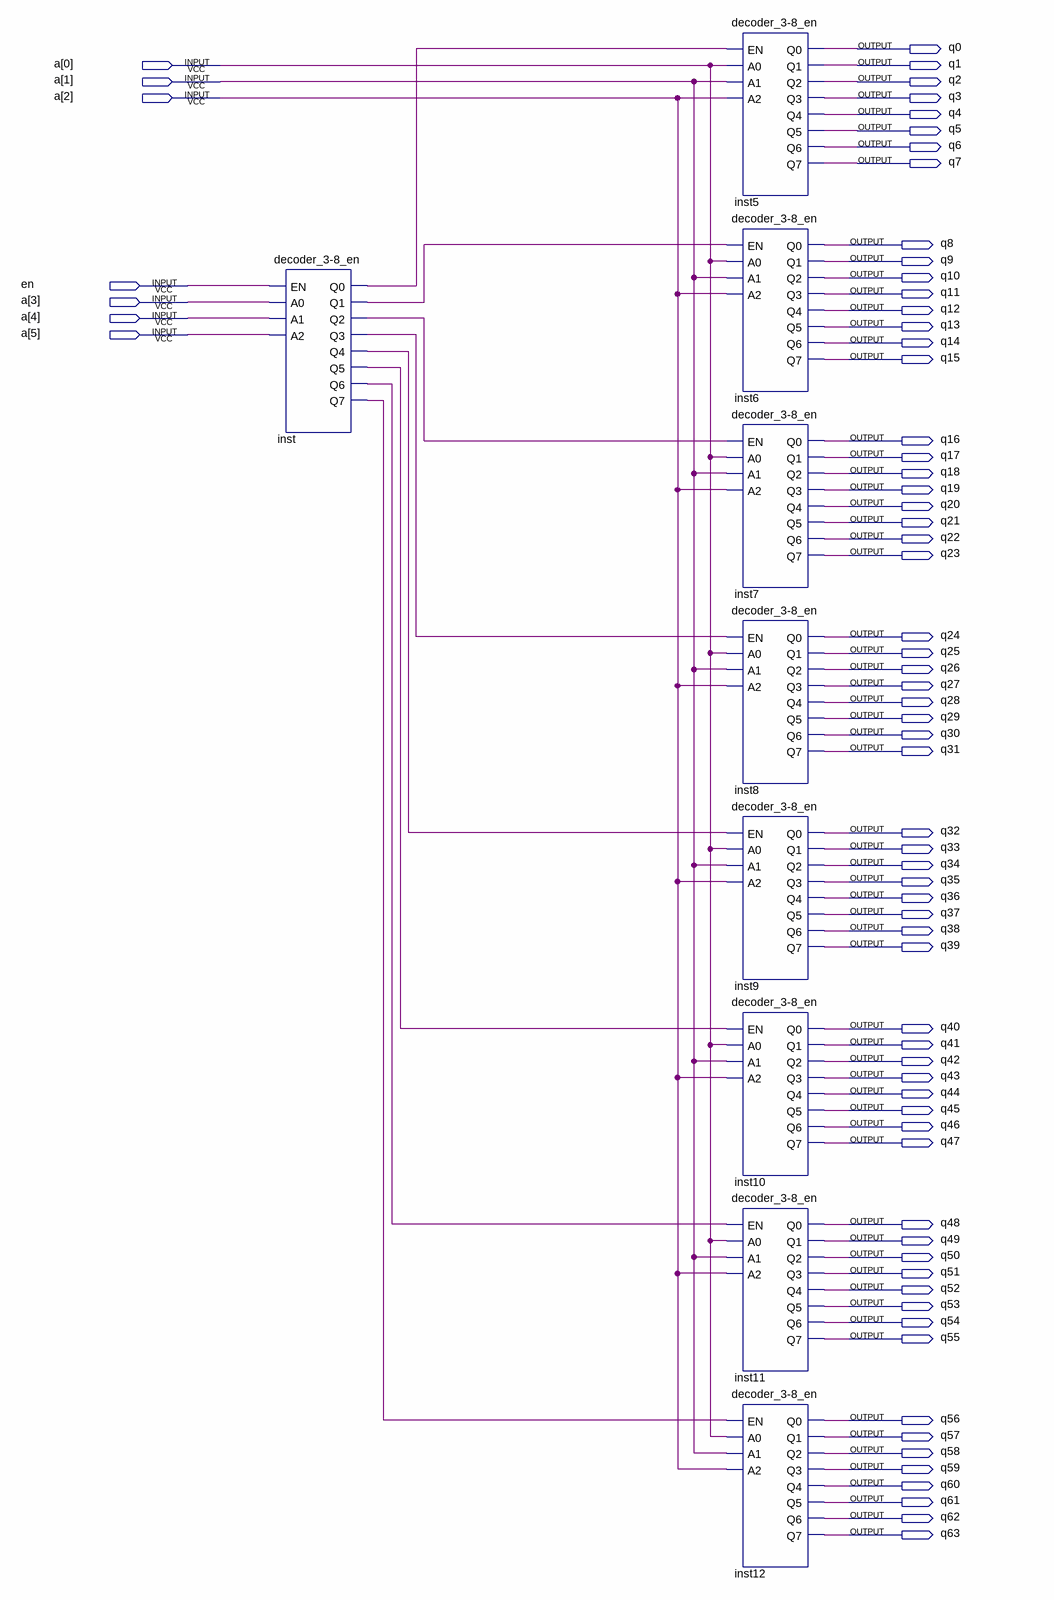
[diagram p0: schematic sheet]
// Quartus schematic decoder_6-64.bdf as structural Verilog: 9 symbols, 71 pins
module \decoder_6-64  (
  input  [5:0] a,
  input  en,
  output q0,
  output q1,
  output q2,
  output q3,
  output q4,
  output q5,
  output q6,
  output q7,
  output q8,
  output q9,
  output q10,
  output q11,
  output q12,
  output q13,
  output q14,
  output q15,
  output q16,
  output q17,
  output q18,
  output q19,
  output q20,
  output q21,
  output q22,
  output q23,
  output q24,
  output q25,
  output q26,
  output q27,
  output q28,
  output q29,
  output q30,
  output q31,
  output q32,
  output q33,
  output q34,
  output q35,
  output q36,
  output q37,
  output q38,
  output q39,
  output q40,
  output q41,
  output q42,
  output q43,
  output q44,
  output q45,
  output q46,
  output q47,
  output q48,
  output q49,
  output q50,
  output q51,
  output q52,
  output q53,
  output q54,
  output q55,
  output q56,
  output q57,
  output q58,
  output q59,
  output q60,
  output q61,
  output q62,
  output q63
);

  wire inst_q0, inst_q1, inst_q2, inst_q3, inst_q4, inst_q5, inst_q6, inst_q7;

  \decoder_3-8_en  inst (
    .EN(en), .A0(a[3]), .A1(a[4]), .A2(a[5]), .Q0(inst_q0), .Q1(inst_q1), .Q2(inst_q2), .Q3(inst_q3),
    .Q4(inst_q4), .Q5(inst_q5), .Q6(inst_q6), .Q7(inst_q7));
  \decoder_3-8_en  inst5 (
    .EN(inst_q0), .A0(a[0]), .A1(a[1]), .A2(a[2]), .Q0(q0), .Q1(q1), .Q2(q2), .Q3(q3), .Q4(q4), .Q5(q5),
    .Q6(q6), .Q7(q7));
  \decoder_3-8_en  inst6 (
    .EN(inst_q1), .A0(a[0]), .A1(a[1]), .A2(a[2]), .Q0(q8), .Q1(q9), .Q2(q10), .Q3(q11), .Q4(q12), .Q5(q13),
    .Q6(q14), .Q7(q15));
  \decoder_3-8_en  inst7 (
    .EN(inst_q2), .A0(a[0]), .A1(a[1]), .A2(a[2]), .Q0(q16), .Q1(q17), .Q2(q18), .Q3(q19), .Q4(q20),
    .Q5(q21), .Q6(q22), .Q7(q23));
  \decoder_3-8_en  inst8 (
    .EN(inst_q3), .A0(a[0]), .A1(a[1]), .A2(a[2]), .Q0(q24), .Q1(q25), .Q2(q26), .Q3(q27), .Q4(q28),
    .Q5(q29), .Q6(q30), .Q7(q31));
  \decoder_3-8_en  inst9 (
    .EN(inst_q4), .A0(a[0]), .A1(a[1]), .A2(a[2]), .Q0(q32), .Q1(q33), .Q2(q34), .Q3(q35), .Q4(q36),
    .Q5(q37), .Q6(q38), .Q7(q39));
  \decoder_3-8_en  inst10 (
    .EN(inst_q5), .A0(a[0]), .A1(a[1]), .A2(a[2]), .Q0(q40), .Q1(q41), .Q2(q42), .Q3(q43), .Q4(q44),
    .Q5(q45), .Q6(q46), .Q7(q47));
  \decoder_3-8_en  inst11 (
    .EN(inst_q6), .A0(a[0]), .A1(a[1]), .A2(a[2]), .Q0(q48), .Q1(q49), .Q2(q50), .Q3(q51), .Q4(q52),
    .Q5(q53), .Q6(q54), .Q7(q55));
  \decoder_3-8_en  inst12 (
    .EN(inst_q7), .A0(a[0]), .A1(a[1]), .A2(a[2]), .Q0(q56), .Q1(q57), .Q2(q58), .Q3(q59), .Q4(q60),
    .Q5(q61), .Q6(q62), .Q7(q63));
endmodule
